# Altium schematic sheet 2.Power.SchDoc: TopLevel Schematic
size A4; Date: 2019/03/06; Author: ZhangPan; Revision: 2.0; SheetNumber: 2; SheetTotal: 4; Size: A4; Contact: 0731-88731029
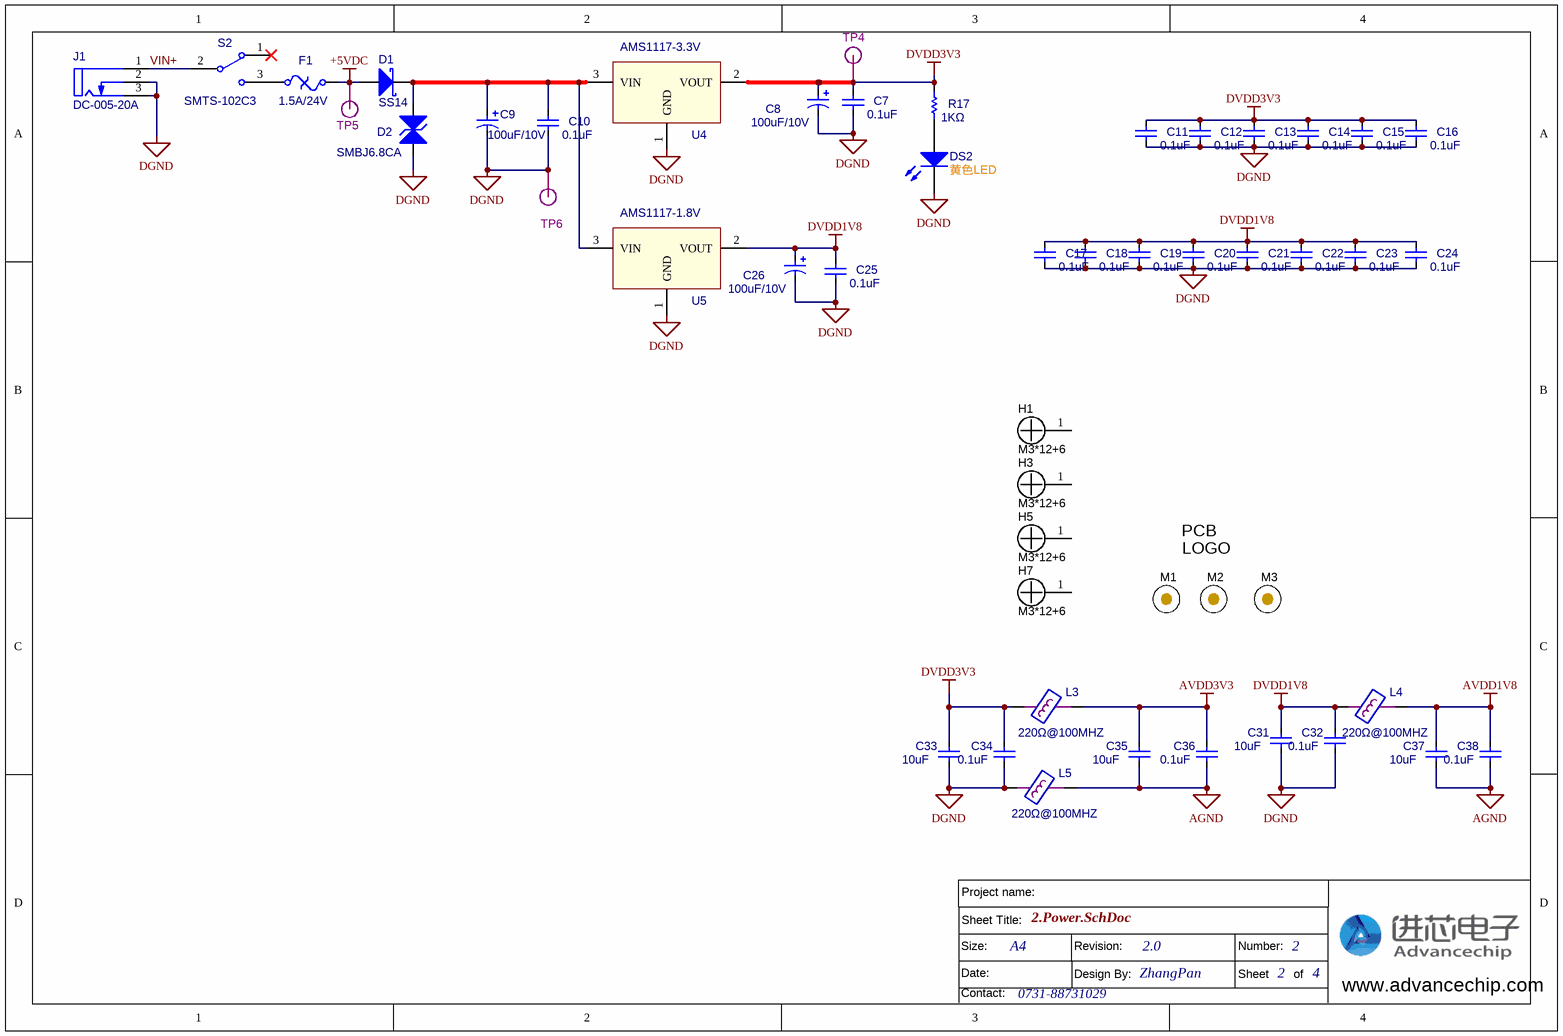
[diagram p0: 2.Power.SchDoc]

## Parts
C7  value 0.1uF  [C0603]  (hidden comment: 0.1uF/50V)
C8  100uF/10V  [CASE-B_3528]
C9  100uF/10V  [CASE-B_3528]
C10  value 0.1uF  [C0603]  (hidden comment: 0.1uF/50V)
C11  value 0.1uF  [C0603]  (hidden comment: 0.1uF/50V)
C12  value 0.1uF  [C0603]  (hidden comment: 0.1uF/50V)
C13  value 0.1uF  [C0603 - duplicate]  (hidden comment: 0.1uF/50V)
C14  value 0.1uF  [C0603]  (hidden comment: 0.1uF/50V)
C15  value 0.1uF  [C0603]  (hidden comment: 0.1uF/50V)
C16  value 0.1uF  [C0603]  (hidden comment: 0.1uF/50V)
C17  value 0.1uF  [C0603]  (hidden comment: 0.1uF/50V)
C18  value 0.1uF  [C0603]  (hidden comment: 0.1uF/50V)
C19  value 0.1uF  [C0603]  (hidden comment: 0.1uF/50V)
C20  value 0.1uF  [C0603]  (hidden comment: 0.1uF/50V)
C21  value 0.1uF  [C0603]  (hidden comment: 0.1uF/50V)
C22  value 0.1uF  [C0603]  (hidden comment: 0.1uF/50V)
C23  value 0.1uF  [C0603]  (hidden comment: 0.1uF/50V)
C24  value 0.1uF  [C0603]  (hidden comment: 0.1uF/50V)
C25  value 0.1uF  [C0603]  (hidden comment: 0.1uF/50V)
C26  100uF/10V  [CASE-B_3528]
C31  value 10uF  [C0603 - duplicate]  (hidden comment: 2.2uF/25V)
C32  value 0.1uF  [C0603]  (hidden comment: 2.2uF/25V)
C33  value 10uF  [C0603]  (hidden comment: 2.2uF/25V)
C34  value 0.1uF  [C0603]  (hidden comment: 2.2uF/25V)
C35  value 10uF  [C0603]  (hidden comment: 2.2uF/25V)
C36  value 0.1uF  [C0603]  (hidden comment: 2.2uF/25V)
C37  value 10uF  [C0603]  (hidden comment: 2.2uF/25V)
C38  value 0.1uF  [C0603]  (hidden comment: 2.2uF/25V)
D1  SS14  [SMA]
D2  SMBJ6.8CA  [SMB2]
DS2  黄色LED  [SMD_LED0805_LED]
F1  1.5A/24V  [1812_PTC_NP]
H1  M3*12+6  [NY PMS 440 0025 PH]
H3  M3*12+6  [NY PMS 440 0025 PH]
H5  M3*12+6  [NY PMS 440 0025 PH]
H7  M3*12+6  [NY PMS 440 0025 PH]
J1  DC-005-20A  [DC-005]
L3  value 220Ω@100MHZ  [L-0805]  (hidden comment: BLM21PG221SN)
L4  value 220Ω@100MHZ  [L-0805]  (hidden comment: BLM21PG221SN)
L5  value 220Ω@100MHZ  [L-0805]  (hidden comment: BLM21PG221SN)
Logo1  CAUTION.  READ USER GUIDE BEFORE USE  [IEC_Caution_Small]  (value not drawn)  (no BOM)
M1  (no value)  [Mark1]
M2  (no value)  [Mark1]
M3  (no value)  [Mark1]
R17  1KΩ  [R0603]
S2  SMTS-102C3  [SW2]
TP4  +3V3  [TEST-0.8/1.5MM]  (value not drawn)
TP5  VIN+  [TEST-0.8/1.5MM]  (value not drawn)
TP6  DGND  [TEST-0.8/1.5MM]  (value not drawn)
U4  AMS1117-3.3V  [SOT-223]
U5  AMS1117-1.8V  [SOT-223]

## Nets
+5VDC: D1.1 F1.2 TP5.1
AGND: C35.2 C36.2 C37.2 C38.2 L5.2
AVDD1V8: C37.1 C38.1 L4.2
AVDD3V3: C35.1 C36.1 L3.2
DGND: C7.2 C8.2 C9.2 C10.2 C11.2 C12.2 C13.2 C14.2 C15.2 C16.2 C17.2 C18.2 C19.2 C20.2 C21.2 C22.2 C23.2 C24.2 C25.2 C26.2 C31.2 C32.2 C33.2 C34.2 D2.1(A) DS2.2(K) J1.2 J1.3 L5.1 TP6.1 U4.1(GND) U5.1(GND)
DVDD1V8: C17.1 C18.1 C19.1 C20.1 C21.1 C22.1 C23.1 C24.1 C25.1 C26.1 C31.1 C32.1 L4.1 U5.2(VOUT)
DVDD3V3: C7.1 C8.1 C11.1 C12.1 C13.1 C14.1 C15.1 C16.1 C33.1 C34.1 L3.1 R17.1 TP4.1 U4.2(VOUT)
VIN+: J1.1 S2.2
NetC9_1: C9.1 C10.1 D1.2 D2.2(K) U4.3(VIN) U5.3(VIN)
NetDS2_1: DS2.1(A) R17.2
NetF1_1: F1.1 S2.3

Not connected (* = marked no-connect by the designer): H1 1; H3 1; H5 1; H7 1; S2 1*

## Notes on the sheet
- Sheet Title:
- Project name:
- Size:
- Date:
- Contact:
- Revision:
- Design By:
- Number:
- Sheet       of
- www.advancechip.com
- (in symbol CMP-0074836-1) PCB; LOGO

## Library data of the parts
C7 C10-C25 C31-C38 = Cap: 贴片电容; Published: 8-Jun-2000; LatestRevisionDate: 17-Jul-2002; LatestRevisionNote: Re-released for DXP Platform.; Publisher: Altium Limited
C8 C9 C26 = CAP2: 钽电容; Brand Name: 三星; Tolerance error: 10%; cost: ￥0.01
D1 = D Schottky: 肖特基二极管; Published: 8-Jun-2000; LatestRevisionDate: 17-Jul-2002; LatestRevisionNote: Re-released for DXP Platform.; Publisher: Altium Limited; Code_JEDEC: DO-214-AA
D2 = TVS: TVS二极管; Published: 8-Jun-2000; LatestRevisionDate: 17-Jul-2002; LatestRevisionNote: Re-released for DXP Platform.; Publisher: Altium Limited
DS2 = LED0: 发光二极管; Published: 8-Jun-2000; LatestRevisionDate: 08-Jul-2005; LatestRevisionNote: Mech Layer 1 removed.; PackageReference: LED-0; Publisher: Altium Limited; PackageDescription: LED; 2 Leads
F1 = Fuse Thermal: 自恢复保险丝; Published: 24-Mar-1999; LatestRevisionDate: 17-Jul-2002; LatestRevisionNote: Re-released for DXP Platform.; PackageReference: PIN-W2/E2.8; Publisher: Altium Limited
H1 H3 H5 H7 = CMP-0003617-1: 安装孔
J1 = DC-005: DC电源接口，内径2.1mm; Published: 24-Mar-1999; LatestRevisionDate: 17-Jul-2002; LatestRevisionNote: Re-released for DXP Platform.; Publisher: Altium Limited
L3-L5 = FB1: 贴片电感; Code_IEC: 1005; Published: 8-Jun-2000; LatestRevisionDate: 29-May-2009; LatestRevisionNote: IPC-7351 Footprint Added.; PackageReference: 0402-A; Publisher: Altium Limited; PackageDescription: Chip Inductor; Code_JEITA: 0402
Logo1 = CMP-0074836-1: IEC 61010-1 Caution Warning
M1-M3 = CMP-0077181-1: MARK点
R17 = Res: 贴片电阻; Value: 1K; Published: 8-Jun-2000; LatestRevisionDate: 17-Jul-2002; LatestRevisionNote: Re-released for DXP Platform.; Publisher: Altium Limited
S2 = SW-SPDT: 红色卧式弯脚小型扭子开关5脚2档; Published: 24-Mar-1999; LatestRevisionDate: 17-Dec-2003; LatestRevisionNote: Schematic revised, PCB Footprint replaced.; DatasheetDocument: 05-Dec-2000; Publisher: Altium Limited
TP4-TP6 = TP: 测试点
U4 U5 = ASM1117-3.3V: 线性稳压器